# EasyEDA Pro project ProDoc_EthernetSwitch_2026-02-25.epro, schematic EthernetSwitch

## Sheets
1 EthernetSwitch: Board Name: EthernetSwitch; Create Date: 2026-02-14; Page Name: EthernetSwitch; Project Name: EthernetSwitch; Schematic Name: EthernetSwitch; Update Date: 2026-02-14; File: EthernetSwitch; Id: /; Sheet: /
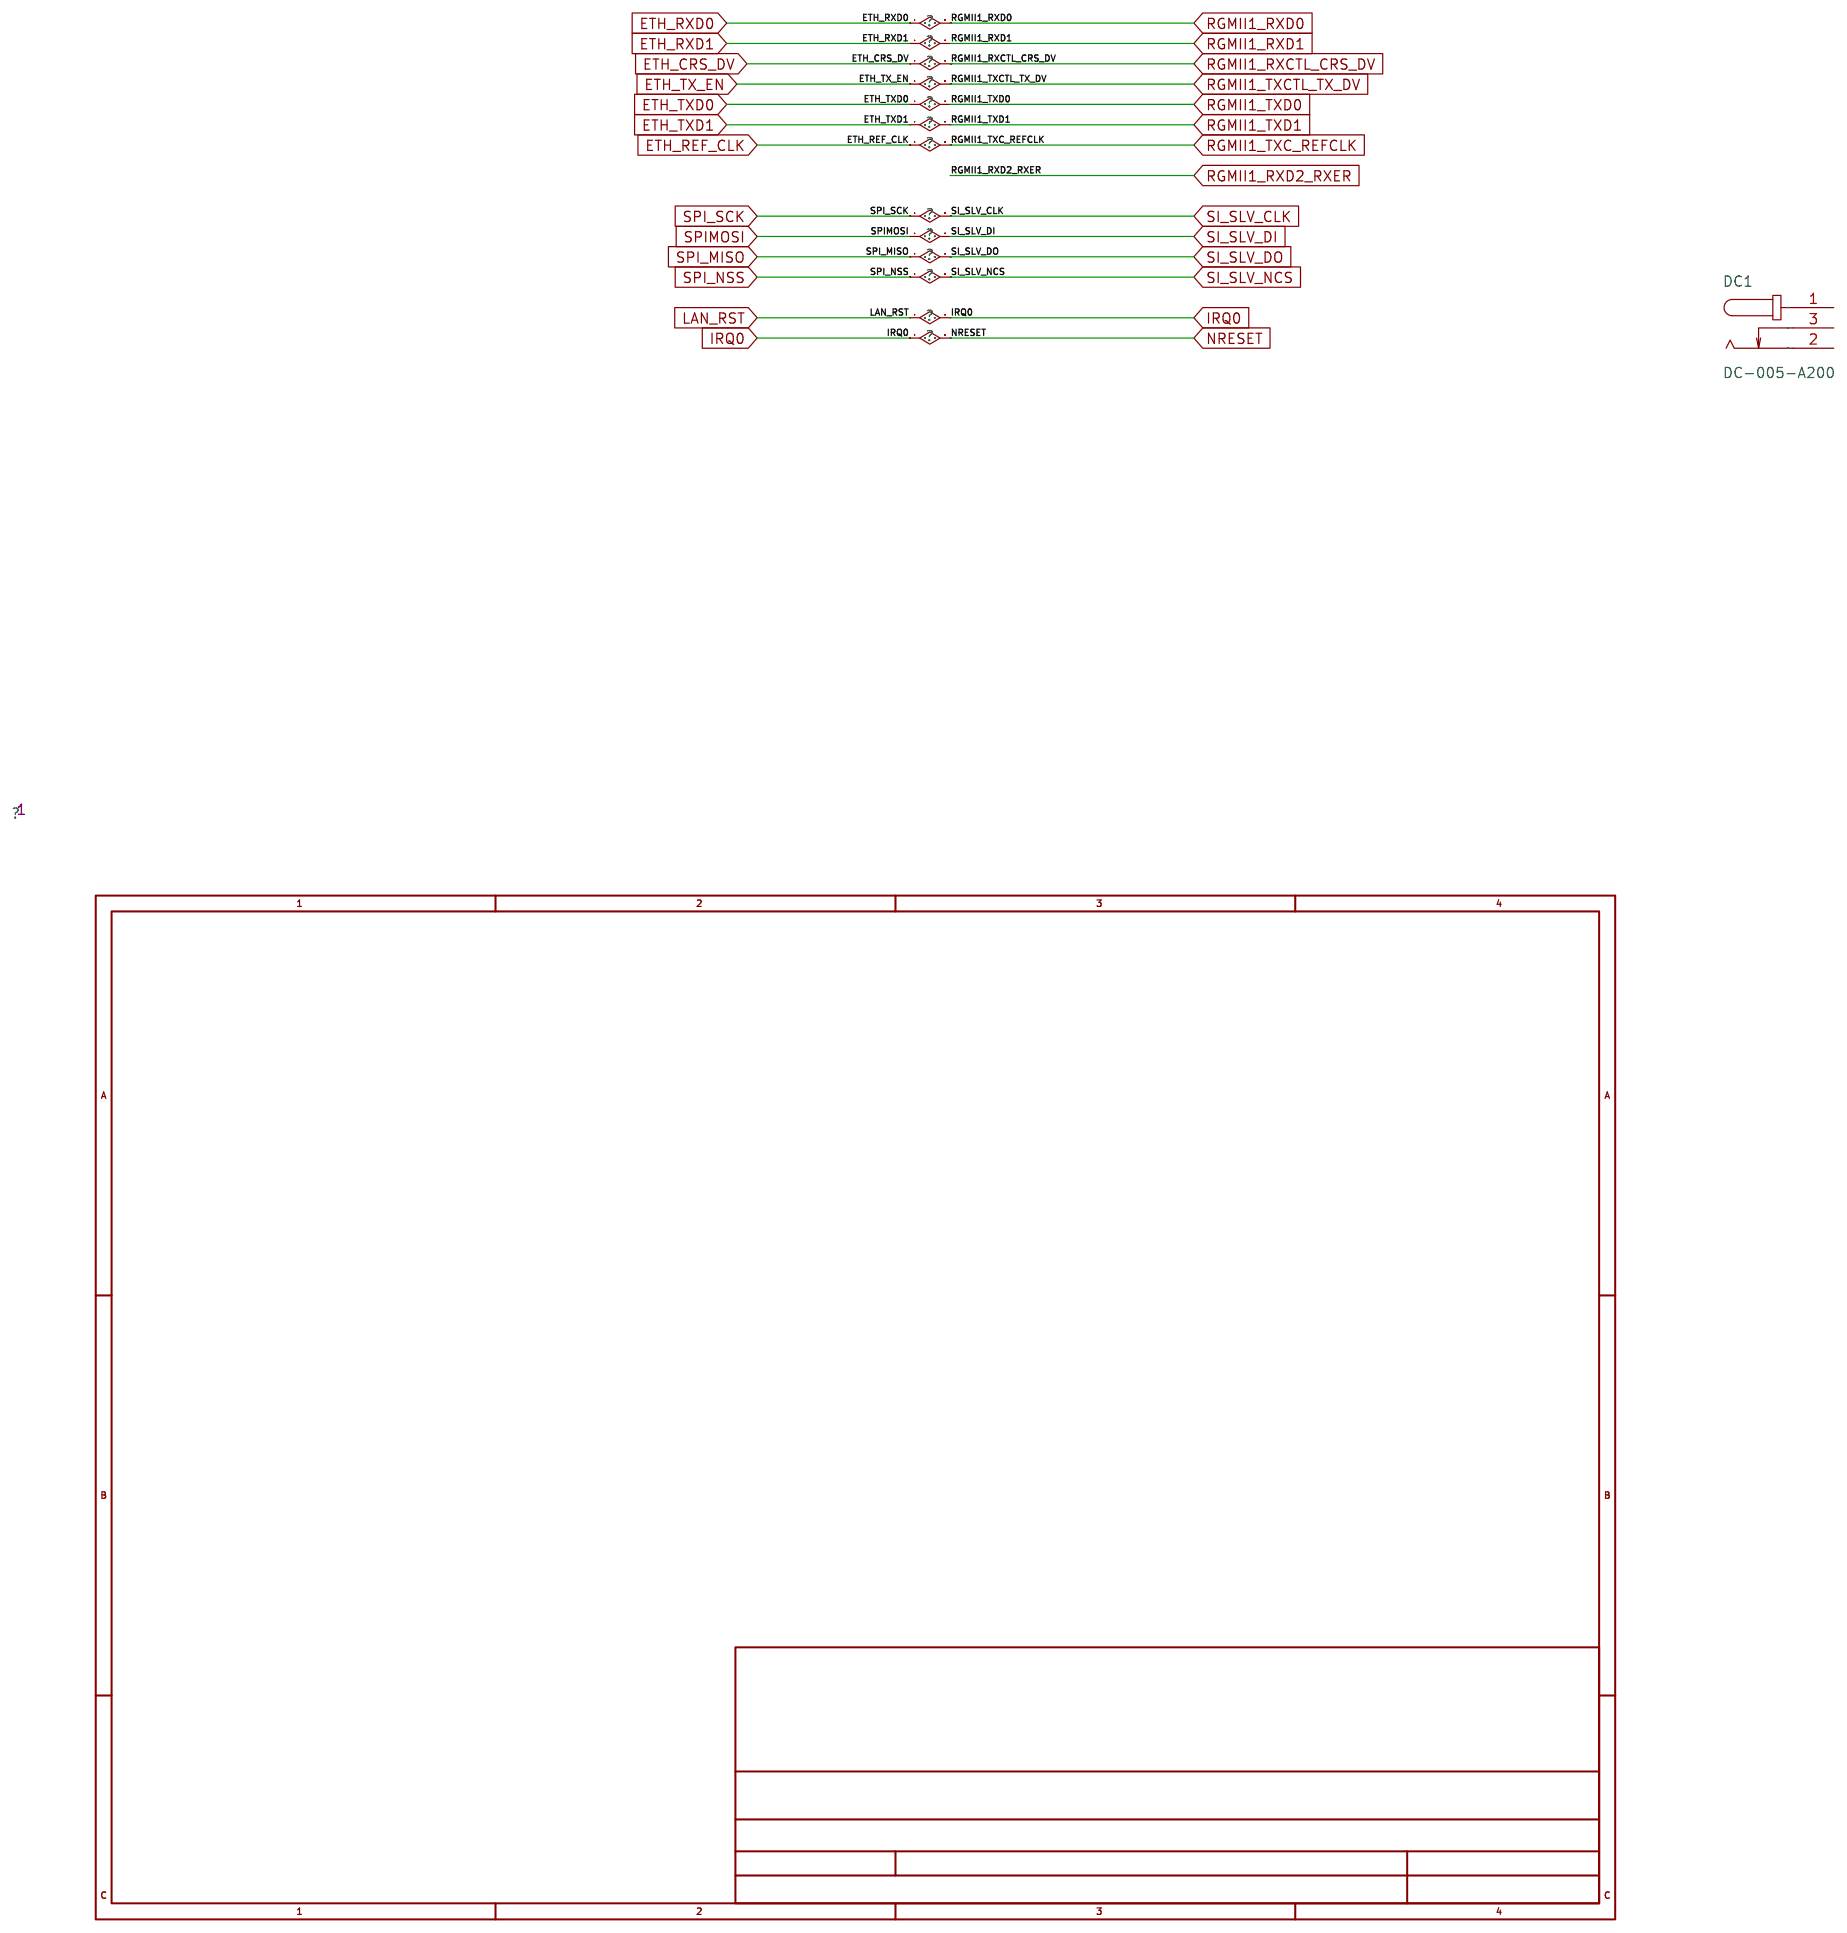
[diagram p0: EthernetSwitch]
2 mcu: Page Name: mcu; Company: EasyEDA.com; Page Size: A4; Version: V1.0
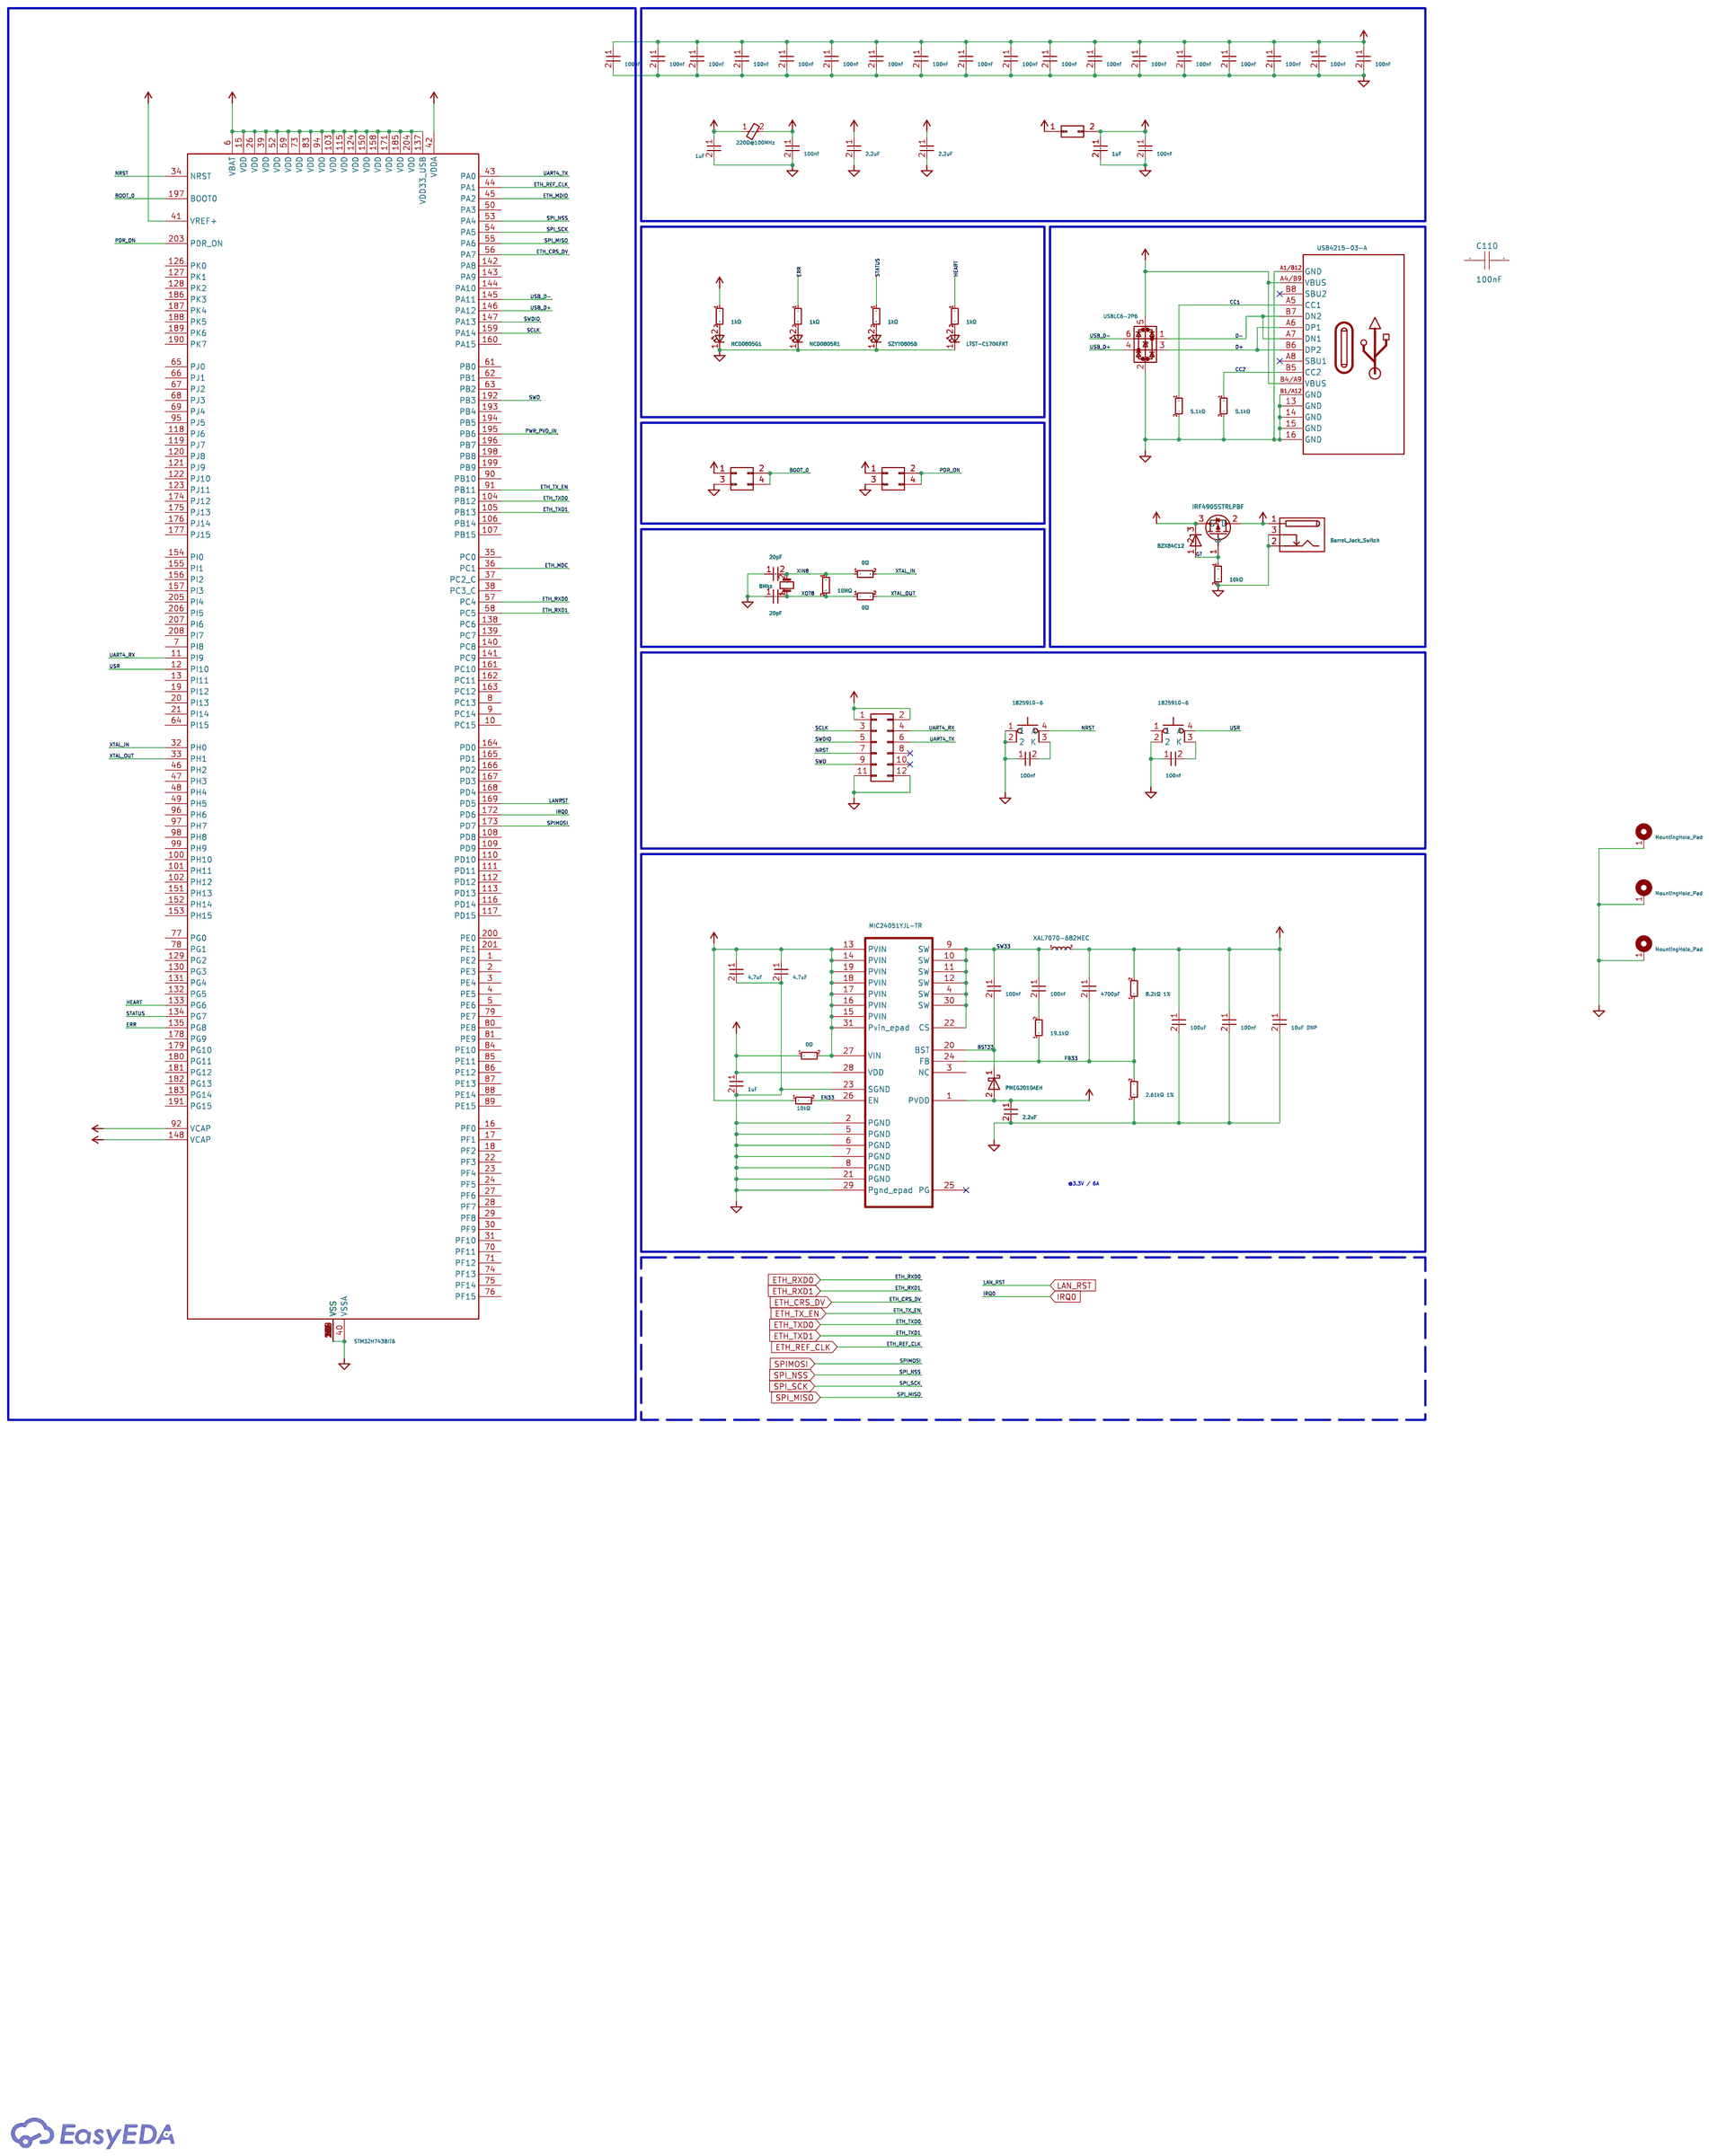
[diagram p1: mcu]
3 switch: Page Name: switch; Company: EasyEDA.com; Page Size: A4; Version: V1.0
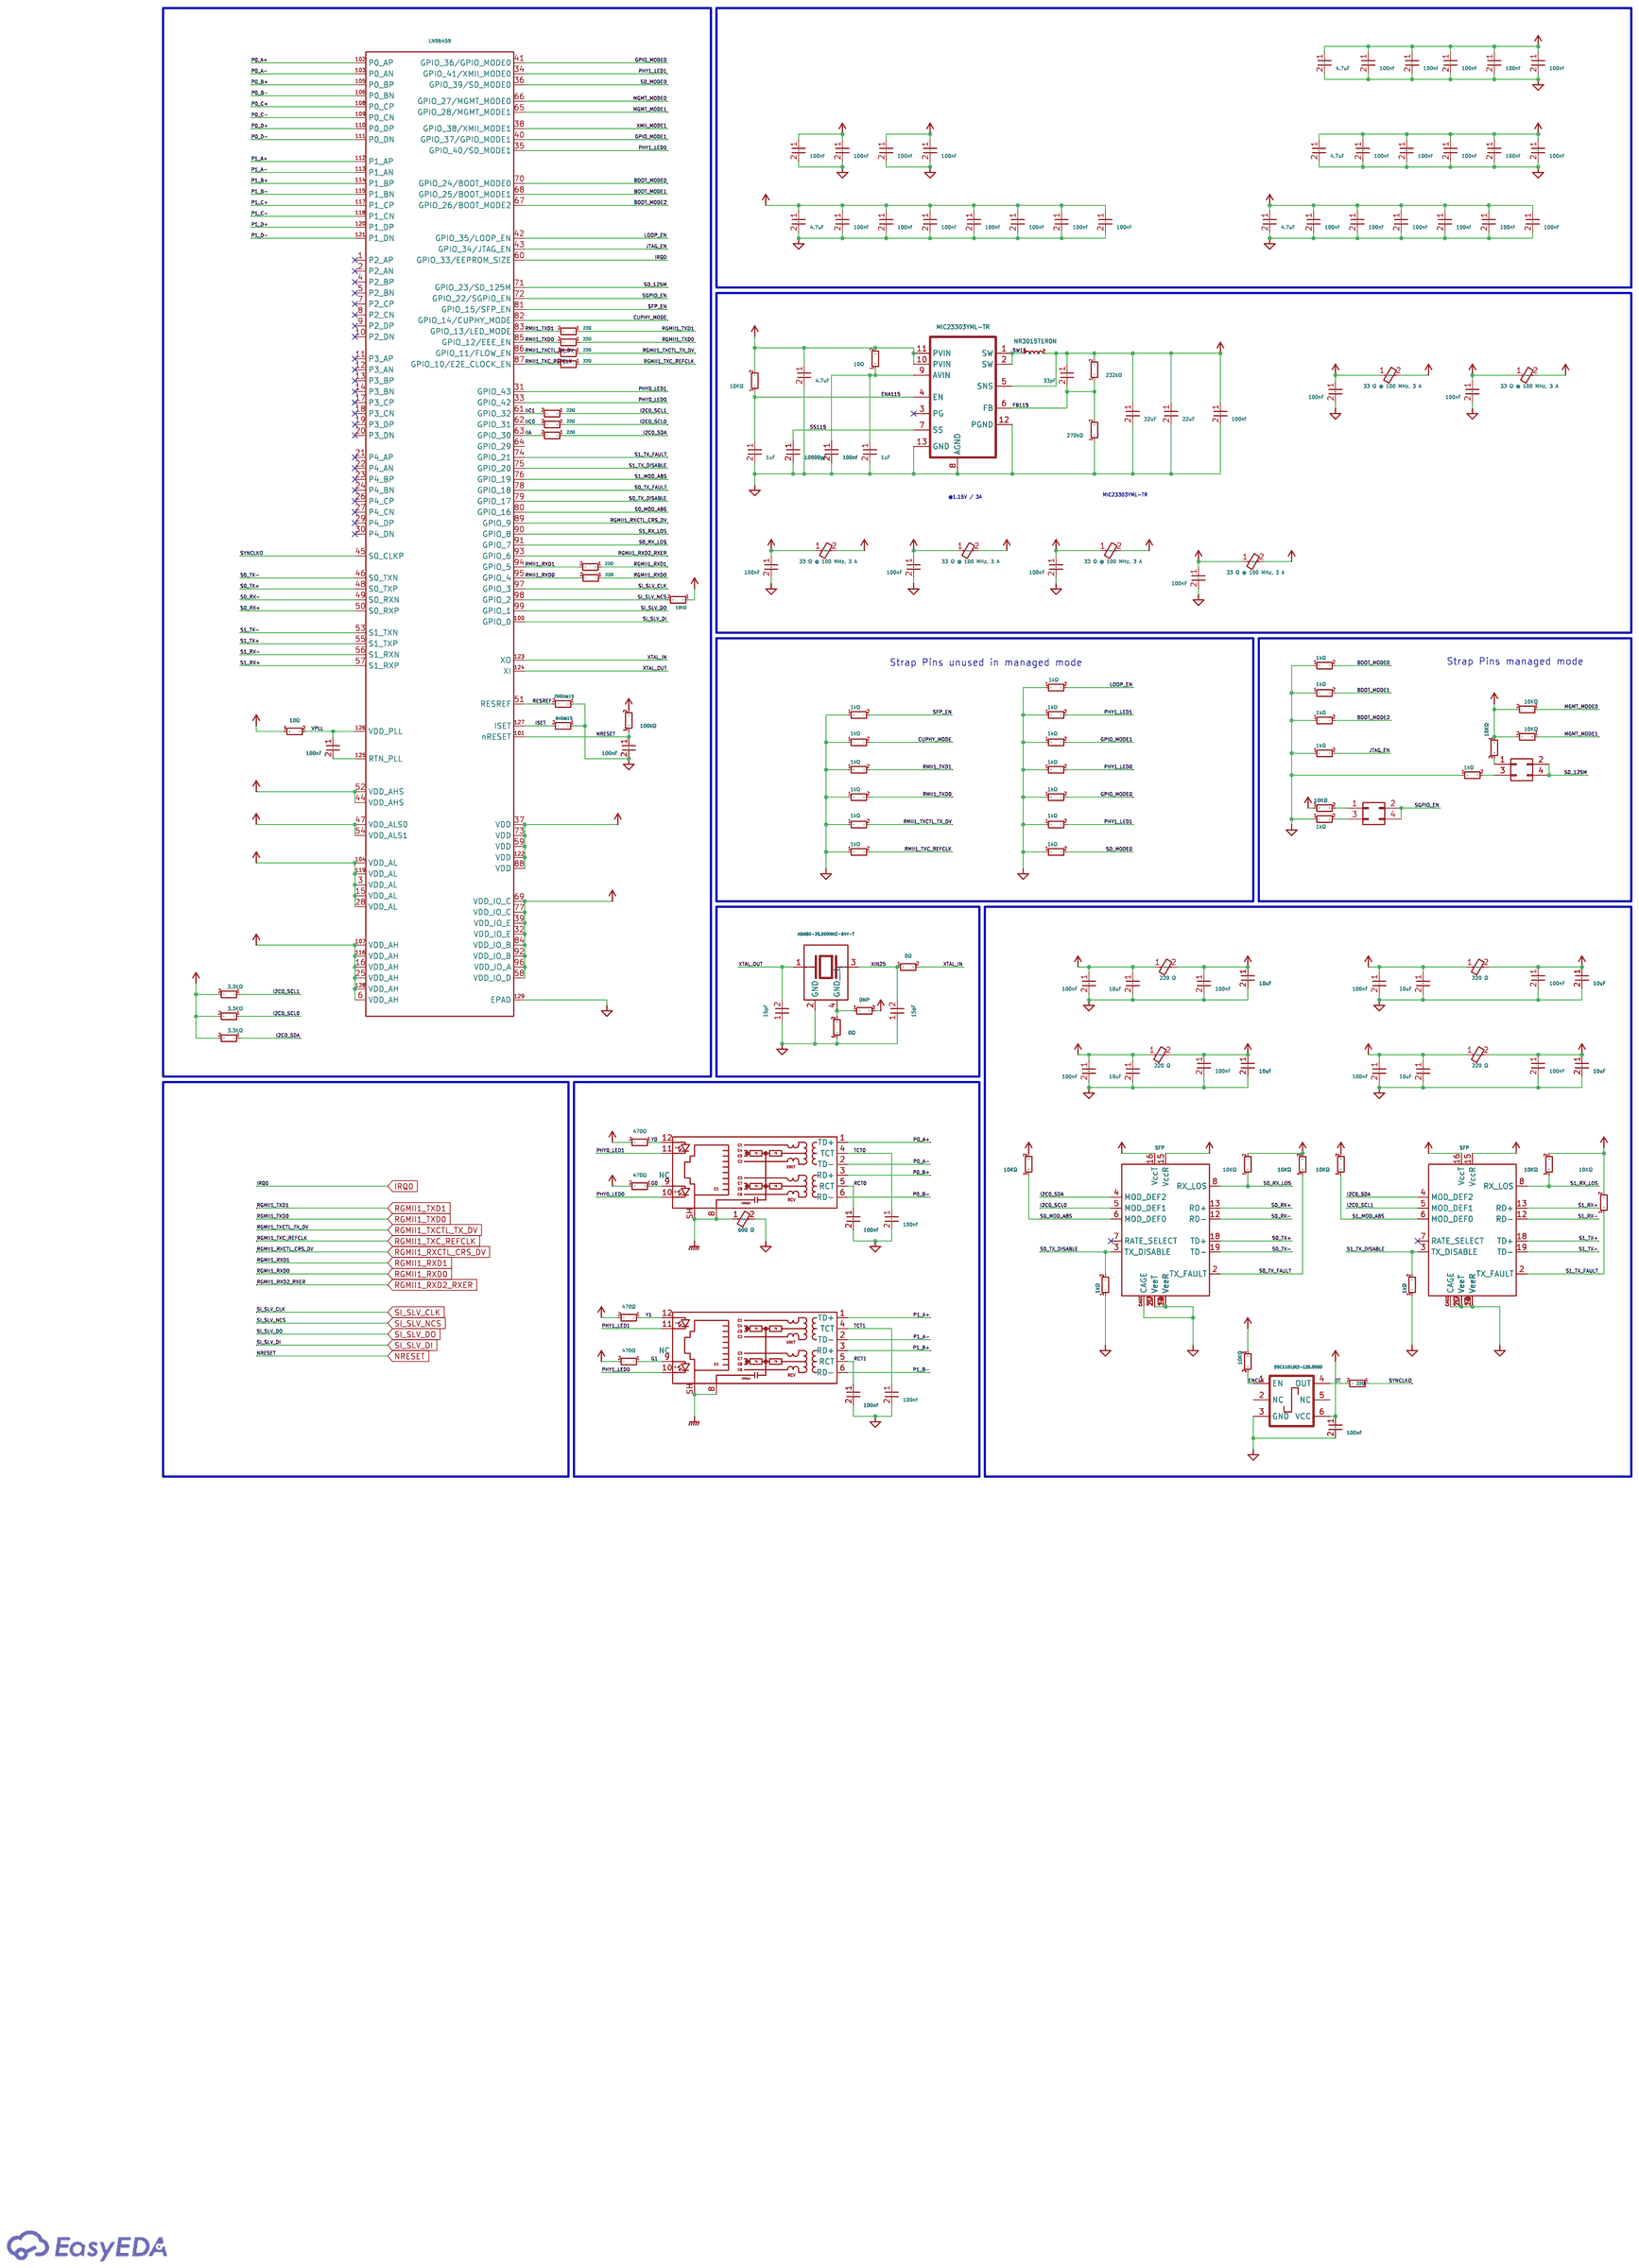
[diagram p2: switch]

## Parts
sheet EthernetSwitch
DC1  DC-005-A200  [DC-IN-TH_DC-005-A200]
sheet mcu
C1  100nf  [Capacitor_SMD:C_0603_1608Metric]
C2  1uF  [Capacitor_SMD:C_0603_1608Metric]
C3  4.7uF  [Capacitor_SMD:C_0603_1608Metric]
C4  1uF  [Capacitor_SMD:C_0805_2012Metric]
C5  100nf  [Capacitor_SMD:C_0603_1608Metric]
C6  20pF  [Capacitor_SMD:C_0805_2012Metric]
C7  20pF  [Capacitor_SMD:C_0805_2012Metric]
C8  4.7uF  [Capacitor_SMD:C_0603_1608Metric]
C9  100nf  [Capacitor_SMD:C_0603_1608Metric]
C10  100nf  [Capacitor_SMD:C_0603_1608Metric]
C11  100nf  [Capacitor_SMD:C_0603_1608Metric]
C12  2.2uF  [Capacitor_SMD:C_0603_1608Metric]
C13  100nf  [Capacitor_SMD:C_0603_1608Metric]
C14  100nf  [Capacitor_SMD:C_0603_1608Metric]
C15  2.2uF  [Capacitor_SMD:C_0603_1608Metric]
C16  100nf  [Capacitor_SMD:C_0603_1608Metric]
C17  100nf  [Capacitor_SMD:C_0805_2012Metric]
C18  100nf  [Capacitor_SMD:C_0603_1608Metric]
C19  2.2uF  [Capacitor_SMD:C_0603_1608Metric]
C20  100nf  [Capacitor_SMD:C_0805_2012Metric]
C21  100nf  [Capacitor_SMD:C_0805_2012Metric]
C22  100nf  [Capacitor_SMD:C_0603_1608Metric]
C23  4700pF  [Capacitor_SMD:C_0402_1005Metric]
C24  100nf  [Capacitor_SMD:C_0603_1608Metric]
C25  1uF  [Capacitor_SMD:C_0603_1608Metric]
C26  100nf  [Capacitor_SMD:C_0603_1608Metric]
C27  100nf  [Capacitor_SMD:C_0603_1608Metric]
C28  100nf  [Capacitor_SMD:C_0805_2012Metric]
C29  100uF  [Capacitor_SMD:C_1206_3216Metric]
C30  100nf  [Capacitor_SMD:C_0603_1608Metric]
C31  100nf  [Capacitor_SMD:C_0603_1608Metric]
C32  100nf  [Capacitor_SMD:C_0805_2012Metric]
C33  100nf  [Capacitor_SMD:C_0603_1608Metric]
C34  10uF DNP  [Capacitor_SMD:C_0805_2012Metric]
C35  100nf  [Capacitor_SMD:C_0603_1608Metric]
C36  100nf  [Capacitor_SMD:C_0603_1608Metric]
C108  100nf  [Capacitor_SMD:C_0603_1608Metric]
C109  100nf  [Capacitor_SMD:C_0603_1608Metric]
C110  100nF  [C0603]
D1  NCD0805G1  [LED_SMD:LED_0603_1608Metric]
D2  NCD0805R1  [LED_SMD:LED_0603_1608Metric]
D3  SZYY0805B  [LED_SMD:LED_0603_1608Metric]
D4  LTST-C170KFKT  [LED_SMD:LED_0603_1608Metric]
D5  PMEG2010AEH  [Diode_SMD:D_SOD-123F]
D6  BZX84C12  [Package_TO_SOT_SMD:SOT-23-3]
FB1  220Ω@100MHz  [Inductor_SMD:L_0805_2012Metric]
H1  MountingHole_Pad  [MountingHole:MountingHole_4.3mm_M4_Pad]
H2  MountingHole_Pad  [MountingHole:MountingHole_4.3mm_M4_Pad]
H3  MountingHole_Pad  [MountingHole:MountingHole_4.3mm_M4_Pad]
J1  Conn_02x02_Row_Letter_Last  [Connector_PinHeader_2.54mm:PinHeader_2x02_P2.54mm_Vertical]
J2  Conn_02x06_Row_Letter_Last  [Connector_PinHeader_2.54mm:PinHeader_2x06_P2.54mm_Vertical]
J3  Conn_02x02_Row_Letter_Last  [Connector_PinHeader_2.54mm:PinHeader_2x02_P2.54mm_Vertical]
J4  Conn_02x01_Row_Letter_First  [Connector_PinHeader_2.54mm:PinHeader_2x01_P2.54mm_Vertical]
J5  Barrel_Jack_Switch  [Connector_BarrelJack:BarrelJack_GCT_DCJ200-10-A_Horizontal]
J13  USB4215-03-A  [USB4215-03-A:CONN_8p94X6p5X3p16_12L_GCC]
L1  XAL7070-682MEC  [XAL7070-682MEC:IND_XAL7070_COC]
Q1  IRF4905STRLPBF  [IRF4905STRLPBF:TRAN_IRF4905STRLPBF_INF]
R1  1kΩ  [Resistor_SMD:R_0603_1608Metric]
R2  1kΩ  [Resistor_SMD:R_0603_1608Metric]
R3  10kΩ  [Resistor_SMD:R_0603_1608Metric]
R4  0Ω  [Resistor_SMD:R_0603_1608Metric]
R5  10MΩ  [Resistor_SMD:R_0603_1608Metric]
R6  0Ω  [Resistor_SMD:R_0603_1608Metric]
R7  0Ω  [Resistor_SMD:R_0603_1608Metric]
R8  1kΩ  [Resistor_SMD:R_0603_1608Metric]
R9  1kΩ  [Resistor_SMD:R_0603_1608Metric]
R10  19.1kΩ  [Resistor_SMD:R_0805_2012Metric]
R11  8.2kΩ 1%  [Resistor_SMD:R_0805_2012Metric]
R12  2.61kΩ 1%  [Resistor_SMD:R_0805_2012Metric]
R13  5.1kΩ  [Resistor_SMD:R_0603_1608Metric]
R14  10kΩ  [Resistor_SMD:R_0603_1608Metric]
R15  5.1kΩ  [Resistor_SMD:R_0603_1608Metric]
SW1  1825910-6  [1825910-6:SW_1825910-6-4]
SW2  1825910-6  [1825910-6:SW_1825910-6-4]
U1  STM32H743BIT6  [Package_QFP:LQFP-208_28x28mm_P0.5mm]
U2  MIC24051YJL-TR  [MIC24051:QFN28_5X6_MCH]
U3  USBLC6-2P6  [Package_TO_SOT_SMD:SOT-666]
Y1  8Mhz  [Crystal:Crystal_SMD_HC49-SD]
sheet switch
C37  100nF  [Capacitor_SMD:C_0603_1608Metric]
C38  100nF  [Capacitor_SMD:C_0603_1608Metric]
C39  1uF  [Capacitor_SMD:C_0805_2012Metric]
C40  100nF  [Capacitor_SMD:C_0603_1608Metric]
C41  15pF  [Capacitor_SMD:C_0603_1608Metric]
C42  10000pF  [Capacitor_SMD:C_0402_1005Metric]
C43  100nf  [Capacitor_SMD:C_0603_1608Metric]
C44  4.7uF  [Capacitor_SMD:C_0603_1608Metric]
C45  4.7uF  [Capacitor_SMD:C_0603_1608Metric]
C46  100nf  [Capacitor_SMD:C_0805_2012Metric]
C47  100nf  [Capacitor_SMD:C_0805_2012Metric]
C48  100nf  [Capacitor_SMD:C_0603_1608Metric]
C49  100nf  [Capacitor_SMD:C_0603_1608Metric]
C50  100nf  [Capacitor_SMD:C_0603_1608Metric]
C51  1uF  [Capacitor_SMD:C_0805_2012Metric]
C52  100nf  [Capacitor_SMD:C_0603_1608Metric]
C53  100nf  [Capacitor_SMD:C_0603_1608Metric]
C54  100nf  [Capacitor_SMD:C_0603_1608Metric]
C55  100nf  [Capacitor_SMD:C_0603_1608Metric]
C56  15pF  [Capacitor_SMD:C_0603_1608Metric]
C57  100nF  [Capacitor_SMD:C_0603_1608Metric]
C58  100nf  [Capacitor_SMD:C_0805_2012Metric]
C59  100nf  [Capacitor_SMD:C_0603_1608Metric]
C60  100nf  [Capacitor_SMD:C_0603_1608Metric]
C61  100nf  [Capacitor_SMD:C_0603_1608Metric]
C62  100nF  [Capacitor_SMD:C_0603_1608Metric]
C63  100nf  [Capacitor_SMD:C_0603_1608Metric]
C64  33pF  [Capacitor_SMD:C_0603_1608Metric]
C65  100nF  [Capacitor_SMD:C_0603_1608Metric]
C66  100nF  [Capacitor_SMD:C_0603_1608Metric]
C67  100nf  [Capacitor_SMD:C_0603_1608Metric]
C68  22uF  [Capacitor_SMD:C_0805_2012Metric]
C69  10uF  [Capacitor_SMD:C_0603_1608Metric]
C70  10uF  [Capacitor_SMD:C_0603_1608Metric]
C71  22uF  [Capacitor_SMD:C_0805_2012Metric]
C72  100nF  [Capacitor_SMD:C_0603_1608Metric]
C73  100nF  [Capacitor_SMD:C_0603_1608Metric]
C74  100nF  [Capacitor_SMD:C_0603_1608Metric]
C75  100nf  [Capacitor_SMD:C_0805_2012Metric]
C76  10uF  [Capacitor_SMD:C_0603_1608Metric]
C77  10uF  [Capacitor_SMD:C_0603_1608Metric]
C78  4.7uF  [Capacitor_SMD:C_0603_1608Metric]
C79  100nf  [Capacitor_SMD:C_0603_1608Metric]
C80  4.7uF  [Capacitor_SMD:C_0603_1608Metric]
C81  4.7uF  [Capacitor_SMD:C_0603_1608Metric]
C82  100nF  [Capacitor_SMD:C_0603_1608Metric]
C83  100nf  [Capacitor_SMD:C_0603_1608Metric]
C84  100nf  [Capacitor_SMD:C_0603_1608Metric]
C85  100nf  [Capacitor_SMD:C_0603_1608Metric]
C86  100nf  [Capacitor_SMD:C_0603_1608Metric]
C87  100nF  [Capacitor_SMD:C_0603_1608Metric]
C88  100nF  [Capacitor_SMD:C_0603_1608Metric]
C89  100nf  [Capacitor_SMD:C_0603_1608Metric]
C90  100nf  [Capacitor_SMD:C_0603_1608Metric]
C91  100nf  [Capacitor_SMD:C_0603_1608Metric]
C92  10uF  [Capacitor_SMD:C_0603_1608Metric]
C93  10uF  [Capacitor_SMD:C_0603_1608Metric]
C94  100nf  [Capacitor_SMD:C_0603_1608Metric]
C95  100nf  [Capacitor_SMD:C_0603_1608Metric]
C96  100nf  [Capacitor_SMD:C_0603_1608Metric]
C97  100nF  [Capacitor_SMD:C_0603_1608Metric]
C98  100nf  [Capacitor_SMD:C_0603_1608Metric]
C99  100nf  [Capacitor_SMD:C_0603_1608Metric]
C100  100nf  [Capacitor_SMD:C_0603_1608Metric]
C101  100nf  [Capacitor_SMD:C_0603_1608Metric]
C102  100nf  [Capacitor_SMD:C_0805_2012Metric]
C103  100nf  [Capacitor_SMD:C_0603_1608Metric]
C104  100nF  [Capacitor_SMD:C_0603_1608Metric]
C105  100nF  [Capacitor_SMD:C_0603_1608Metric]
C106  10uF  [Capacitor_SMD:C_0603_1608Metric]
C107  10uF  [Capacitor_SMD:C_0603_1608Metric]
FB2  600 Ω  [Inductor_SMD:L_0603_1608Metric]
FB4  33 Ω @ 100 MHz, 3 A  [Inductor_SMD:L_0603_1608Metric]
FB5  33 Ω @ 100 MHz, 3 A  [Inductor_SMD:L_0603_1608Metric]
FB6  33 Ω @ 100 MHz, 3 A  [Inductor_SMD:L_0603_1608Metric]
FB7  220 Ω  [Inductor_SMD:L_0603_1608Metric]
FB8  220 Ω  [Inductor_SMD:L_0603_1608Metric]
FB10  33 Ω @ 100 MHz, 3 A  [Inductor_SMD:L_0603_1608Metric]
FB11  33 Ω @ 100 MHz, 3 A  [Inductor_SMD:L_0603_1608Metric]
FB13  220 Ω  [Inductor_SMD:L_0603_1608Metric]
FB14  220 Ω  [Inductor_SMD:L_0603_1608Metric]
FB15  33 Ω @ 100 MHz, 3 A  [Inductor_SMD:L_0603_1608Metric]
J7  RJ45_Hanrun_HR911105A_Horizontal  [Connector_RJ:RJ45_Hanrun_HR911105A_Horizontal]
J8  RJ45_Hanrun_HR911105A_Horizontal  [Connector_RJ:RJ45_Hanrun_HR911105A_Horizontal]
J9  SFP  [Connector:Connector_SFP_and_Cage]
J10  Conn_02x02_Row_Letter_Last  [Connector_PinHeader_2.54mm:PinHeader_2x02_P2.54mm_Vertical]
J11  SFP  [Connector:Connector_SFP_and_Cage]
J12  Conn_02x02_Row_Letter_Last  [Connector_PinHeader_2.54mm:PinHeader_2x02_P2.54mm_Vertical]
L2  NR3015T1R0N  [NR3015T1R0N:IND_TAIYO_NR3015_TAY]
R16  3.3KΩ  [Resistor_SMD:R_0603_1608Metric]
R17  3.3KΩ  [Resistor_SMD:R_0603_1608Metric]
R18  3.3KΩ  [Resistor_SMD:R_0603_1608Metric]
R19  10Ω  [Resistor_SMD:R_0603_1608Metric]
R20  22Ω  [Resistor_SMD:R_0603_1608Metric]
R21  22Ω  [Resistor_SMD:R_0603_1608Metric]
R22  22Ω  [Resistor_SMD:R_0603_1608Metric]
R23  22Ω  [Resistor_SMD:R_0603_1608Metric]
R24  22Ω  [Resistor_SMD:R_0603_1608Metric]
R25  22Ω  [Resistor_SMD:R_0603_1608Metric]
R26  22Ω  [Resistor_SMD:R_0603_1608Metric]
R27  22Ω  [Resistor_SMD:R_0603_1608Metric]
R28  22Ω  [Resistor_SMD:R_0603_1608Metric]
R29  200Ω@1%  [Resistor_SMD:R_0805_2012Metric]
R30  6kΩ@1%  [Resistor_SMD:R_0805_2012Metric]
R31  100kΩ  [Resistor_SMD:R_0603_1608Metric]
R32  470Ω  [Resistor_SMD:R_0603_1608Metric]
R33  470Ω  [Resistor_SMD:R_0603_1608Metric]
R34  470Ω  [Resistor_SMD:R_0603_1608Metric]
R35  470Ω  [Resistor_SMD:R_0603_1608Metric]
R36  10KΩ  [Resistor_SMD:R_0603_1608Metric]
R37  10KΩ  [Resistor_SMD:R_0603_1608Metric]
R38  0Ω  [Resistor_SMD:R_0603_1608Metric]
R39  1kΩ  [Resistor_SMD:R_0603_1608Metric]
R40  1kΩ  [Resistor_SMD:R_0603_1608Metric]
R41  1kΩ  [Resistor_SMD:R_0603_1608Metric]
R42  1kΩ  [Resistor_SMD:R_0603_1608Metric]
R43  1kΩ  [Resistor_SMD:R_0603_1608Metric]
R44  1kΩ  [Resistor_SMD:R_0603_1608Metric]
R45  DNP  [Resistor_SMD:R_0805_2012Metric]
R46  10Ω  [Resistor_SMD:R_0603_1608Metric]
R47  0Ω  [Resistor_SMD:R_0603_1608Metric]
R48  10KΩ  [Resistor_SMD:R_0603_1608Metric]
R49  1kΩ  [Resistor_SMD:R_0603_1608Metric]
R50  1kΩ  [Resistor_SMD:R_0603_1608Metric]
R51  1kΩ  [Resistor_SMD:R_0603_1608Metric]
R52  1kΩ  [Resistor_SMD:R_0603_1608Metric]
R53  1kΩ  [Resistor_SMD:R_0603_1608Metric]
R54  1kΩ  [Resistor_SMD:R_0603_1608Metric]
R55  1kΩ  [Resistor_SMD:R_0603_1608Metric]
R56  232kΩ  [Resistor_SMD:R_0805_2012Metric]
R57  270kΩ  [Resistor_SMD:R_0603_1608Metric]
R58  1kΩ  [Resistor_SMD:R_0603_1608Metric]
R59  10KΩ  [Resistor_SMD:R_0603_1608Metric]
R60  10KΩ  [Resistor_SMD:R_0603_1608Metric]
R61  10KΩ  [Resistor_SMD:R_0603_1608Metric]
R62  1kΩ  [Resistor_SMD:R_0603_1608Metric]
R63  1kΩ  [Resistor_SMD:R_0603_1608Metric]
R64  1kΩ  [Resistor_SMD:R_0603_1608Metric]
R65  1kΩ  [Resistor_SMD:R_0603_1608Metric]
R66  10KΩ  [Resistor_SMD:R_0603_1608Metric]
R67  1kΩ  [Resistor_SMD:R_0603_1608Metric]
R68  10KΩ  [Resistor_SMD:R_0603_1608Metric]
R69  22Ω  [Resistor_SMD:R_0603_1608Metric]
R70  1kΩ  [Resistor_SMD:R_0603_1608Metric]
R71  1kΩ  [Resistor_SMD:R_0603_1608Metric]
R72  10KΩ  [Resistor_SMD:R_0603_1608Metric]
R73  10KΩ  [Resistor_SMD:R_0603_1608Metric]
R74  10KΩ  [Resistor_SMD:R_0603_1608Metric]
R75  10KΩ  [Resistor_SMD:R_0603_1608Metric]
R76  10KΩ  [Resistor_SMD:R_0603_1608Metric]
U4  LN96459  [Library:128-TQFP]
U5  MIC23303YML-TR  [MIC23303:DFN12_3X3_ML_MCH]
Y2  ABM8G-25.000MHZ-B4Y-T  [ABM8G-25.000MHZ-B4Y-T:XTAL_ABM8G-25.000MHZ-B4Y-T]
Y3  DSC1101BI2-125.0000  [Library:6-VDFN]

## Library data of the parts
DC1 = DC-005-A200: Connector Type:DC Power Jack Mounting Type:Right Angle Inside Contact Diameter:2mm Outside Contact Diameter:6.4mm Current Rating:3A Voltage Rating (Max):30V Operating Temperature:-20℃~+70℃ Operating Temperature:-20℃~+70℃; LCSC Part Name: DC电源插座 内径:2mm 外径:6.4mm; Supplier Part: C720557; Manufacturer: XUNPU(讯普); Supplier Footprint: 插件; JLCPCB Part Class: Extended Part; Datasheet: https://item.szlcsc.com/datasheet/DC-005-A200/763564.html; Supplier: LCSC; Connector Type: DC Power Jack; Mounting Type: Right Angle; Inside Contact Diameter: 2mm; Outside Contact Diameter: 6.4mm; Current Rating: 3A; Voltage Rating (Max): 30V; Operating Temperature: -20℃~+70℃
C1-C3 C5 C9-C16 C18 C19 C22 C24-C27 C30 C31 C33 C35 C36 C108 C109 = Device_C_Small: Unpolarized capacitor, small symbol; Field5: C1608X5R1C475K080AC; ref: C1608X5R1C225K
C4 C6 C7 C17 C20 C21 C28 C32 C34 = Device_C_Small: Unpolarized capacitor, small symbol
C8 = Device_C_Small: Unpolarized capacitor, small symbol; Field5: 'C1608X5R1C475K080AC; ref: C1608X5R1C225K
C23 = Device_C_Small: Unpolarized capacitor, small symbol; ref: GRM155R71C472KA01D
C29 = Device_C_Small: Unpolarized capacitor, small symbol; ref: C3225X5R0J107M250AC
C110 = CC0603KRX7R9BB104: Capacitance:100nF Tolerance:±10% Tolerance:±10% Voltage Rating:50V Temperature Coefficient:X7R; LCSC Part Name: 100nF ±10% 50V; Supplier Part: C14663; Manufacturer: YAGEO(国巨); Supplier Footprint: 0603; JLCPCB Part Class: Basic Part; Datasheet: https://item.szlcsc.com/datasheet/CC0603KRX7R9BB104/15331.html; Supplier: LCSC; Tolerance: ±10%; Voltage Rating: 50V; Temperature Coefficient: X7R
D1-D3 = Device_LED_Small: Light emitting diode, small symbol; Attribute1: D4; Sim_Pins: 1=K 2=A; Sim.Pins: 1=K 2=A
D4 = Device_LED_Small: Light emitting diode, small symbol; Sim_Pins: 1=K 2=A; Sim.Pins: 1=K 2=A
D5 = Diode_PMEG2010AEH: 20V, 1A very low Vf MEGA Schottky barrier rectifier, SOD-123F; Datasheet: https://assets.nexperia.com/documents/data-sheet/PMEG2010AEH_PMEG2010AET.pdf; User doc link: https://assets.nexperia.com/documents/data-sheet/PMEG2010AEH_PMEG2010AET.pdf
D6 = Diode_BZX84Cxx: 300mW Zener Diode, SOT-23; Datasheet: https://diotec.com/tl_files/diotec/files/pdf/datasheets/bzx84c2v4.pdf; User doc link: https://diotec.com/tl_files/diotec/files/pdf/datasheets/bzx84c2v4.pdf
FB1 = Device_FerriteBead_Small: Ferrite bead, small symbol
H1 H3 = Mechanical_MountingHole_Pad: Mounting Hole with connection; Attribute1: H2
H2 = Mechanical_MountingHole_Pad: Mounting Hole with connection
J1 J3 J10 = Connector_Generic_Conn_02x02_Row_Letter_Last: Generic connector, double row, 02x02, row letter last pin numbering scheme (pin number consists of a letter for the row and a number for the pin index in this row. 1a, ..., Na; 1b, ..., Nb)), script generated (kicad-library-utils/schlib/autogen/connector/)
J2 = Connector_Generic_Conn_02x06_Row_Letter_Last: Generic connector, double row, 02x06, row letter last pin numbering scheme (pin number consists of a letter for the row and a number for the pin index in this row. 1a, ..., Na; 1b, ..., Nb)), script generated (kicad-library-utils/schlib/autogen/connector/)
J4 = Connector_Generic_Conn_02x01_Row_Letter_First: Generic connector, double row, 02x01, row letter first pin numbering scheme (pin number consists of a letter for the row and a number for the pin index in this row. a1, ..., aN; b1, ..., bN), script generated (kicad-library-utils/schlib/autogen/connector/)
J5 = Connector_Barrel_Jack_Switch: DC Barrel Jack with an internal switch
J13 = USB4215-03-A_USB4215-03-A
L1 = XAL7070-682MEC_XAL7070-682MEC
Q1 = IRF4905STRLPBF_IRF4905STRLPBF: Attribute1: *; Attribute2: *; Attribute4: *; Attribute5: *; Datasheet: https://www.infineon.com/dgdl/irf4905spbf.pdf?fileId=5546d462533600a4015355e331c41980; User doc link: https://www.infineon.com/dgdl/irf4905spbf.pdf?fileId=5546d462533600a4015355e331c41980
R1-R15 = Device_R_Small: Resistor, small symbol
SW1 SW2 = 1825910-6_1825910-6: PARTREV: C10; STANDARD: Manufacturer Recommendations; MANUFACTURER: TE CONNECTIVITY
U1 = MCU_ST_STM32H7_STM32H743BITx: STMicroelectronics Arm Cortex-M7 MCU, 2048KB flash, 1024KB RAM, 480 MHz, 1.62-3.6V, 168 GPIO, LQFP208; Datasheet: https://www.st.com/resource/en/datasheet/stm32h743bi.pdf; User doc link: https://www.st.com/resource/en/datasheet/stm32h743bi.pdf
U2 = MIC24051_MIC24051YJL-TR: Attribute1: *; Attribute2: *; Attribute3: *; Attribute4: *
U3 = Power_Protection_USBLC6-2P6: Very low capacitance ESD protection diode, 2 data-line, SOT-666; Datasheet: https://www.st.com/resource/en/datasheet/usblc6-2.pdf; User doc link: https://www.st.com/resource/en/datasheet/usblc6-2.pdf
Y1 = Device_Crystal_Small: Two pin crystal, small symbol; Datasheet: https://www.lcsc.com/datasheet/C12674.pdf; REF: X49SM8MSD2SC; User doc link: https://www.lcsc.com/datasheet/C12674.pdf
C37 C38 C40 C43 C44 C48-C50 C52-C57 C59-C63 C65-C67 C69 C70 C72-C74 C76-C101 C103-C107 = Device_C_Small: Unpolarized capacitor, small symbol; Attribute1: C36; ref: GRM1555C1H150JA01D
C39 C46 C47 C51 C58 C68 C71 C75 C102 = Device_C_Small: Unpolarized capacitor, small symbol; Attribute1: C21; ref: C2012X5R1C226K
C41 = Device_C_Small: Unpolarized capacitor, small symbol; Attribute1: C36; ref: GRM1555C1H150JA01D; REF: GRM1555C1H150JA01D
C42 = Device_C_Small: Unpolarized capacitor, small symbol; ref: C0402C103K4RACTU
C45 = Device_C_Small: Unpolarized capacitor, small symbol; Attribute1: C36; ref: 06036D475KAT2A
C64 = Device_C_Small: Unpolarized capacitor, small symbol; Attribute1: C36; ref: GMC10CG330J50NTLF
FB2 FB4-FB8 FB10 FB13-FB15 = Device_FerriteBead_Small: Ferrite bead, small symbol; Attribute1: FB11; Field5: MPZ2012S601AT000
FB11 = Device_FerriteBead_Small: Ferrite bead, small symbol; Field5: MPZ2012S601AT000
J7 = Connector_RJ45_Hanrun_HR911105A_Horizontal: 1 Port RJ45 Magjack Connector Through Hole 10/100 Base-T, AutoMDIX; Datasheet: https://datasheet.lcsc.com/lcsc/1811141815_HANRUN-Zhongshan-HanRun-Elec-HR911105A_C12074.pdf; User doc link: https://datasheet.lcsc.com/lcsc/1811141815_HANRUN-Zhongshan-HanRun-Elec-HR911105A_C12074.pdf
J8 = Connector_RJ45_Hanrun_HR911105A_Horizontal: 1 Port RJ45 Magjack Connector Through Hole 10/100 Base-T, AutoMDIX; Attribute1: J7; Datasheet: https://datasheet.lcsc.com/lcsc/1811141815_HANRUN-Zhongshan-HanRun-Elec-HR911105A_C12074.pdf; User doc link: https://datasheet.lcsc.com/lcsc/1811141815_HANRUN-Zhongshan-HanRun-Elec-HR911105A_C12074.pdf
J9 = Interface_Optical_SFP: Connector for Small Form Factor Pluggable (SFP) module, 1 Gbit/s, serial-to-serial data-agnostic optical transceiver; Attribute1: PCB edge; Attribute2: Component and trace keepout; Attribute3: (except chassis ground); Datasheet: http://www.10gtek.com/templates/wzten/pdf/INF-8074.pdf; User doc link: http://www.10gtek.com/templates/wzten/pdf/INF-8074.pdf
J11 = Interface_Optical_SFP: Connector for Small Form Factor Pluggable (SFP) module, 1 Gbit/s, serial-to-serial data-agnostic optical transceiver; Attribute1: PCB edge; Attribute2: Component and trace keepout; Attribute3: (except chassis ground); Attribute4: J9; Datasheet: http://www.10gtek.com/templates/wzten/pdf/INF-8074.pdf; User doc link: http://www.10gtek.com/templates/wzten/pdf/INF-8074.pdf
J12 = Connector_Generic_Conn_02x02_Row_Letter_Last: Generic connector, double row, 02x02, row letter last pin numbering scheme (pin number consists of a letter for the row and a number for the pin index in this row. 1a, ..., Na; 1b, ..., Nb)), script generated (kicad-library-utils/schlib/autogen/connector/); Attribute1: J10
L2 = NR3015T1R0N_NR3015T1R0N
R16-R28 R31-R44 R46-R55 R57-R76 = Device_R_Small: Resistor, small symbol; Attribute1: R9
R29 R30 R45 R56 = Device_R_Small: Resistor, small symbol; Attribute1: R11
U4 = lanchip_LAN96459S
U5 = MIC23303_MIC23303YML-TR
Y2 = ABM8G-25.000MHZ-B4Y-T_ABM8G-25.000MHZ-B4Y-T: PARTREV: 08.13.15; STANDARD: Manufacturer Recommendations; MAXIMUM_PACKAGE_HEIGHT: 1.0 mm; MANUFACTURER: Abracon
Y3 = lanchip_DSC1101BI2-125.0000: Low-Jitter Precision CMOS Oscillator; Datasheet: https://ww1.microchip.com/downloads/aemDocuments/documents/TCG/ProductDocuments/DataSheets/DSC1101-21-Low-Jitter-Precision-CMOS-Oscillator-DS20005613D.pdf; User doc link: https://ww1.microchip.com/downloads/aemDocuments/documents/TCG/ProductDocuments/DataSheets/DSC1101-21-Low-Jitter-Precision-CMOS-Oscillator-DS20005613D.pdf

## Nets
+1V15: C40.1 C57.1 C62.1 C64.1 C68.1 C71.1 C75.1 C81.1 C86.1 C91.1 C95.1 C99.1 C102.1 FB4.1 FB5.1 FB6.1 L2.2 R56.2 U4.37(VDD) U4.59(VDD) U4.73(VDD) U4.88(VDD) U4.122(VDD) U5.5(SNS)
+3V3A: C10.1 FB1.2 U1.42(VDDA)
VBUS: C3.1 C8.1 J13.A4/B9(VBUS) J13.B4/A9(VBUS) R3.1 R4.2 U2.13(PVIN) U2.14(PVIN) U2.15(PVIN) U2.16(PVIN) U2.17(PVIN) U2.18(PVIN) U2.19(PVIN) U2.27(VIN) U2.31(Pvin_epad) U3.5(VBUS)
VCCR1: C74.1 C77.1 FB7.2 J9.15(VccR)
VCCR2: C104.1 C106.1 FB13.2 J11.15(VccR)
VCCT1: C73.1 C76.1 FB8.2 J9.16(VccT)
VCCT2: C105.1 C107.1 FB14.2 J11.16(VccT)
VDDAH_PHY: C78.1 C79.1 C84.1 C89.1 C94.1 C98.1 C101.1 FB11.2 U4.6(VDD_AH) U4.16(VDD_AH) U4.25(VDD_AH) U4.107(VDD_AH) U4.116(VDD_AH) U4.128(VDD_AH)
VDDAH_SRDS: C43.1 C47.1 FB15.2
VDDAL_PHY: C80.1 C85.1 C90.1 C96.1 C100.1 C103.1 FB4.2 U4.3(VDD_AL) U4.15(VDD_AL) U4.28(VDD_AL) U4.104(VDD_AL) U4.119(VDD_AL)
VDDAL_PLL: FB6.2 R19.1 U4.44(VDD_AHS) U4.52(VDD_AHS)
VDDAL_SRDS: C52.1 C58.1 FB5.2 U4.47(VDD_ALS0) U4.54(VDD_ALS1)
VDDIO: C44.1 C48.1 C53.1 C59.1 C60.1 C61.1 C63.1 C67.1 FB10.2 U4.32(VDD_IO_E) U4.39(VDD_IO_E) U4.58(VDD_IO_D) U4.69(VDD_IO_C) U4.77(VDD_IO_C) U4.84(VDD_IO_B) U4.92(VDD_IO_B) U4.96(VDD_IO_A)
BOOT_0: J1.2(Pin_1b) J1.4(Pin_2b) U1.197(BOOT0)
BOOT_MODE0: R62.2 U4.70(GPIO_24/BOOT_MODE0)
BOOT_MODE1: R63.2 U4.68(GPIO_25/BOOT_MODE1)
BOOT_MODE2: R64.2 U4.67(GPIO_26/BOOT_MODE2)
BST33: C17.2 D5.1(K) U2.20(BST)
CC1: J13.A5(CC1) R13.1
CC2: J13.B5(CC2) R15.1
CUPHY_MODE: R40.2 U4.82(GPIO_14/CUPHY_MODE)
D+: J13.A6(DP1) J13.B6(DP2) U3.3(I/O2)
D-: J13.A7(DN1) J13.B7(DN2) U3.1(I/O1)
EN33: R3.2 U2.26(EN)
ENA115: C39.1 R37.1 U5.4(EN)
ENCLK: R60.2 Y3.1(EN)
ERR: R2.1 U1.135(PG8)
ETH_CRS_DV: U1.56(PA7) U4.89(GPIO_9)
ETH_MDC: U1.36(PC1)
ETH_MDIO: U1.45(PA2)
ETH_REF_CLK: R24.1 U1.44(PA1)
ETH_RXD0: U1.57(PC4)
ETH_RXD1: R20.1 U1.58(PC5)
ETH_TX_EN: R23.1 U1.91(PB11)
ETH_TXD0: R22.1 U1.104(PB12)
ETH_TXD1: R21.1 U1.105(PB13)
FB33: C23.2 R10.1 R11.1 R12.2 U2.24(FB)
FB115: C64.2 R56.1 R57.2 U5.6(FB)
G0: J7.9 R35.1
G1: J8.9 R33.1
GPIO_MODE0: R53.2 U4.41(GPIO_36/GPIO_MODE0)
GPIO_MODE1: R51.2 U4.40(GPIO_37/GPIO_MODE1)
GT: D6.1(A) Q1.1(G) R14.1
HEART: R9.1 U1.133(PG6)
I2C0_SCL0: J9.5(MOD_DEF1) R17.1 R26.1
I2C0_SCL1: J11.5(MOD_DEF1) R16.1 R25.1
I2C0_SDA: J9.4(MOD_DEF2) J11.4(MOD_DEF2) R18.1 R27.1
IIA: R27.2 U4.63(GPIO_30)
IIC0: R26.2 U4.62(GPIO_31)
IIC1: R25.2 U4.61(GPIO_32)
IRQ0: C38.1 R31.1 U1.172(PD6) U4.60(GPIO_33/EEPROM_SIZE) U4.101(nRESET)
ISET: R30.2 U4.127(ISET)
JTAG_EN: R65.2 U4.43(GPIO_34/JTAG_EN)
LANRST: U1.169(PD5)
LOOP_EN: R49.2 U4.42(GPIO_35/LOOP_EN)
MGMT_MODE0: R73.1 U4.66(GPIO_27/MGMT_MODE0)
MGMT_MODE1: R74.1 U4.65(GPIO_28/MGMT_MODE1)
NRST: J2.7(Pin_4a) SW1.4(A) U1.34(NRST)
OT: R69.2 Y3.4(OUT)
P0_A+: J7.1(TD+) U4.102(P0_AP)
P0_A-: J7.2(TD-) U4.103(P0_AN)
P0_B+: J7.3(RD+) U4.105(P0_BP)
P0_B-: J7.6(RD-) U4.106(P0_BN)
P0_C+: U4.108(P0_CP)
P0_C-: U4.109(P0_CN)
P0_D+: U4.110(P0_DP)
P0_D-: U4.111(P0_DN)
P1_A+: J8.1(TD+) U4.112(P1_AP)
P1_A-: J8.2(TD-) U4.113(P1_AN)
P1_B+: J8.3(RD+) U4.114(P1_BP)
P1_B-: J8.6(RD-) U4.115(P1_BN)
P1_C+: U4.117(P1_CP)
P1_C-: U4.118(P1_CN)
P1_D+: U4.120(P1_DP)
P1_D-: U4.121(P1_DN)
PDR_ON: J3.2(Pin_1b) J3.4(Pin_2b) U1.203(PDR_ON)
PHY0_LED0: J7.10 U4.33(GPIO_42)
PHY0_LED1: J7.11 U4.31(GPIO_43)
PHY1_LED0: J8.10 R52.2 U4.35(GPIO_40/SD_MODE1)
PHY1_LED1: J8.11 R50.2 R54.2 U4.34(GPIO_41/XMII_MODE0)
POWER_+3V3: C1.1 C2.1 C4.1 C5.1 C9.1 C11.1 C13.1 C14.1 C16.1 C18.1 C19.1 C22.1 C23.1 C24.1 C26.1 C29.1 C30.1 C31.1 C32.1 C33.1 C34.1 C35.1 C36.1 C45.1 C65.1 C66.1 C69.1 C70.1 C72.1 C82.1 C83.1 C87.1 C88.1 C92.1 C93.1 C97.1 C108.1 C109.1 D5.2(A) D6.3(K) FB1.1 FB7.1 FB8.1 FB10.1 FB11.1 FB13.1 FB14.1 FB15.1 J1.1(Pin_1a) J2.1(Pin_1a) J2.2(Pin_1b) J3.1(Pin_1a) J4.1(Pin_a1) L1.2 Q1.3(S) R1.1 R4.1 R11.2 R16.2 R17.2 R18.2 R31.2 R32.2 R33.2 R34.2 R35.2 R36.1 R37.2 R45.2 R46.2 R48.2 R59.2 R60.1 R61.2 R66.1 R68.2 R72.1 R73.2 R74.2 R75.2 R76.2 U1.6(VBAT) U1.15(VDD) U1.26(VDD) U1.39(VDD) U1.52(VDD) U1.59(VDD) U1.73(VDD) U1.83(VDD) U1.94(VDD) U1.103(VDD) U1.115(VDD) U1.124(VDD) U1.137(VDD33_USB) U1.150(VDD) U1.158(VDD) U1.171(VDD) U1.185(VDD) U1.204(VDD) U2.1(PVDD) U2.28(VDD) U5.10(PVIN) U5.11(PVIN) Y3.6(VCC)
POWER_GND: C1.2 C2.2 C3.2 C4.2 C5.2 C6.1 C7.1 C8.2 C9.2 C10.2 C11.2 C12.2 C13.2 C14.2 C15.2 C16.2 C18.2 C19.2 C20.1 C22.2 C24.2 C25.2 C26.2 C27.2 C28.1 C29.2 C30.2 C31.2 C32.2 C33.2 C34.2 C35.2 C36.2 C38.2 C39.2 C40.2 C41.1 C42.2 C43.2 C44.2 C45.2 C46.2 C47.2 C48.2 C49.2 C50.2 C51.2 C52.2 C53.2 C54.2 C55.2 C56.1 C57.2 C58.2 C59.2 C60.2 C61.2 C62.2 C63.2 C65.2 C66.2 C67.2 C68.2 C69.2 C70.2 C71.2 C72.2 C73.2 C74.2 C75.2 C76.2 C77.2 C78.2 C79.2 C80.2 C81.2 C82.2 C83.2 C84.2 C85.2 C86.2 C87.2 C88.2 C89.2 C90.2 C91.2 C92.2 C93.2 C94.2 C95.2 C96.2 C97.2 C98.2 C99.2 C100.2 C101.2 C102.2 C103.2 C104.2 C105.2 C106.2 C107.2 C108.2 C109.2 D1.1(K) D2.1(K) D3.1(K) D4.1(K) FB2.2 H1.1 H2.1 H3.1 J1.3(Pin_2a) J2.11(1Pin_6a) J2.12(Pin_6b) J3.3(Pin_2a) J5.2 J5.3 J9.1(VeeT) J9.9(VeeR) J9.10(VeeR) J9.11(VeeR) J9.14(VeeR) J9.17(VeeT) J9.20(VeeT) J9.CAGE J11.1(VeeT) J11.9(VeeR) J11.10(VeeR) J11.11(VeeR) J11.14(VeeR) J11.17(VeeT) J11.20(VeeT) J11.CAGE J13.13(GND) J13.14(GND) J13.15(GND) J13.16(GND) J13.A1/B12(GND) J13.B1/A12(GND) R12.1 R13.2 R14.2 R15.2 R29.1 R30.1 R38.1 R39.1 R40.1 R41.1 R42.1 R43.1 R44.1 R49.1 R50.1 R51.1 R52.1 R53.1 R54.1 R55.1 R57.1 R58.1 R62.1 R63.1 R64.1 R65.1 R67.1 R70.1 R71.1 SW1.1 SW1.2 SW2.2 U1.14(VSS) U1.25(VSS) U1.40(VSSA) U1.51(VSS) U1.60(VSS) U1.72(VSS) U1.82(VSS) U1.93(VSS) U1.114(VSS) U1.125(VSS) U1.136(VSS) U1.149(VSS) U1.170(VSS) U1.184(VSS) U1.202(VSS) U2.2(PGND) U2.5(PGND) U2.6(PGND) U2.7(PGND) U2.8(PGND) U2.21(PGND) U2.23(SGND) U2.29(Pgnd_epad) U3.2(GND) U4.129(EPAD) U5.8(AGND) U5.12(PGND) U5.13(GND) Y2.2(GND) Y3.3(GND)
POWER_GNDPWR: FB2.1 J7.8 J7.SH J8.8 J8.SH
PWR_PVD_IN: U1.195(PB6)
RCT0: C49.1 J7.5(RCT)
RCT1: C50.1 J8.5(RCT)
RESREF: R29.2 U4.51(RESREF)
RGMII1_RXD2_RXER: U4.93(GPIO_6)
RMII1_RXD0: R28.2 U4.95(GPIO_4)
RMII1_RXD1: R20.2 U4.94(GPIO_5)
RMII1_TXC_REFCLK: R24.2 R44.2 U4.87(GPIO_10/E2E_CLOCK_EN)
RMII1_TXCTL_TX_DV: R23.2 R43.2 U4.86(GPIO_11/FLOW_EN)
RMII1_TXD0: R22.2 R42.2 U4.85(GPIO_12/EEE_EN)
RMII1_TXD1: R21.2 R41.2 U4.83(GPIO_13/LED_MODE)
S0_MOD_ABS: J9.6(MOD_DEF0) R48.1 U4.80(GPIO_16)
S0_RX+: J9.13(RD+) U4.50(S0_RXP)
S0_RX-: J9.12(RD-) U4.49(S0_RXN)
S0_RX_LOS: J9.8(RX_LOS) R59.1 U4.91(GPIO_7)
S0_TX+: J9.18(TD+) U4.48(S0_TXP)
S0_TX-: J9.19(TD-) U4.46(S0_TXN)
S0_TX_DISABLE: J9.3(TX_DISABLE) R58.2 U4.79(GPIO_17)
S0_TX_FAULT: J9.2(TX_FAULT) R61.1 U4.78(GPIO_18)
S1_MOD_ABS: J11.6(MOD_DEF0) R68.1 U4.76(GPIO_19)
S1_RX+: J11.13(RD+) U4.57(S1_RXP)
S1_RX-: J11.12(RD-) U4.56(S1_RXN)
S1_RX_LOS: J11.8(RX_LOS) R75.1 U4.90(GPIO_8)
S1_TX+: J11.18(TD+) U4.55(S1_TXP)
S1_TX-: J11.19(TD-) U4.53(S1_TXN)
S1_TX_DISABLE: J11.3(TX_DISABLE) R70.2 U4.75(GPIO_20)
S1_TX_FAULT: J11.2(TX_FAULT) R76.1 U4.74(GPIO_21)
SCLK: J2.3(Pin_2a) U1.159(PA14)
SD_125M: J12.2(Pin_1b) J12.4(Pin_2b) U4.71(GPIO_23/SD_125M)
SD_MODE0: R55.2 U4.36(GPIO_39/SD_MODE0)
SFP_EN: R39.2 U4.81(GPIO_15/SFP_EN)
SGPIO_EN: J10.2(Pin_1b) J10.4(Pin_2b) U4.72(GPIO_22/SGPIO_EN)
SI_SLV_CLK: U1.54(PA5) U4.97(GPIO_3)
SI_SLV_DI: U1.173(PD7) U4.100(GPIO_0)
SI_SLV_DO: U1.55(PA6) U4.99(GPIO_1)
SI_SLV_NCS: R36.2 U1.53(PA4) U4.98(GPIO_2)
SS115: C42.1 U5.7(SS)
STATUS: R8.1 U1.134(PG7)
SW15: L2.1 U5.1(SW) U5.2(SW)
SW33: C17.1 C21.1 L1.1 U2.4(SW) U2.9(SW) U2.10(SW) U2.11(SW) U2.12(SW) U2.22(CS) U2.30(SW)
SWDIO: J2.5(Pin_3a) U1.147(PA13)
SWO: J2.9(Pin_5a) U1.192(PB3)
SYNCLKO: R69.1 U4.45(S0_CLKP)
TCT0: C54.1 J7.4(TCT)
TCT1: C55.1 J8.4(TCT)
UART4_RX: J2.4(Pin_2b) U1.11(PI9)
UART4_TX: J2.6(Pin_3b) U1.43(PA0)
USB_D+: U1.146(PA12) U3.4(I/O2)
USB_D-: U1.145(PA11) U3.6(I/O1)
USR: SW2.4(A) U1.12(PI10)
VCAP1: C15.1 U1.148(VCAP)
VCAP2: C12.1 U1.92(VCAP)
VCON: J5.1 Q1.2(D)
VPLL: C37.1 R19.2 U4.126(VDD_PLL)
VREF+: C25.1 C27.1 J4.2(Pin_b1) U1.41(VREF+)
XIN8: C6.2 R5.1 R6.1 Y1.2
XIN25: C56.2 R47.1 Y2.3
XMII_MODE1: U4.38(GPIO_38/XMII_MODE1)
XOT8: C7.2 R5.2 R7.1 Y1.1
XTAL_IN: R6.2 R47.2 U1.32(PH0) U4.123(XO)
XTAL_OUT: C41.2 R7.2 U1.33(PH1) U4.124(XI) Y2.1
Y0: J7.12 R34.1
Y1: J8.12 R32.1
NET-(C21-PAD2): C21.2 R10.2
NET-(D1-A): D1.2(A) R1.2
NET-(D2-A): D2.2(A) R2.2
NET-(D3-A): D3.2(A) R8.2
NET-(D4-A): D4.2(A) R9.2
NET-(J10-PIN_1A): J10.1(Pin_1a) R66.2
NET-(J10-PIN_2A): J10.3(Pin_2a) R67.2
NET-(J12-PIN_1A): J12.1(Pin_1a) R72.2
NET-(J12-PIN_2A): J12.3(Pin_2a) R71.2
NET-(SW1-K): C20.2 SW1.3(K)
NET-(SW2-K): C28.2 SW2.3(K)
NET-(U4-RTN_PLL): C37.2 U4.125(RTN_PLL)
NET-(U5-AVIN): C46.1 C51.1 R46.1 U5.9(AVIN)
NET-(Y2-GND__1): R38.2 R45.1 Y2.4(GND__1)

Not connected (* = marked no-connect by the designer): C110 1 2; D6 2(NC); DC1 1 2 3; J2 8(Pin_4b)* 10(Pin_5b)*; J7 7(NC); J8 7(NC); J9 7(RATE_SELECT)*; J11 7(RATE_SELECT)*; J13 A8(SBU1)* B8(SBU2)*; R28 1; SW2 1; U1 1(PE2) 2(PE3) 3(PE4) 4(PE5) 5(PE6) 7(PI8) 8(PC13) 9(PC14) 10(PC15) 13(PI11) 16(PF0) 17(PF1) 18(PF2) 19(PI12) 20(PI13) 21(PI14) 22(PF3) 23(PF4) 24(PF5) 27(PF6) 28(PF7) 29(PF8) 30(PF9) 31(PF10) 35(PC0) 37(PC2_C) 38(PC3_C) 46(PH2) 47(PH3) 48(PH4) 49(PH5) 50(PA3) 61(PB0) 62(PB1) 63(PB2) 64(PI15) 65(PJ0) 66(PJ1) 67(PJ2) 68(PJ3) 69(PJ4) 70(PF11) 71(PF12) 74(PF13) 75(PF14) 76(PF15) 77(PG0) 78(PG1) 79(PE7) 80(PE8) 81(PE9) 84(PE10) 85(PE11) 86(PE12) 87(PE13) 88(PE14) 89(PE15) 90(PB10) 95(PJ5) 96(PH6) 97(PH7) 98(PH8) 99(PH9) 100(PH10) 101(PH11) 102(PH12) 106(PB14) 107(PB15) 108(PD8) 109(PD9) 110(PD10) 111(PD11) 112(PD12) 113(PD13) 116(PD14) 117(PD15) 118(PJ6) 119(PJ7) 120(PJ8) 121(PJ9) 122(PJ10) 123(PJ11) 126(PK0) 127(PK1) 128(PK2) 129(PG2) 130(PG3) 131(PG4) 132(PG5) 138(PC6) 139(PC7) 140(PC8) 141(PC9) 142(PA8) 143(PA9) 144(PA10) 151(PH13) 152(PH14) 153(PH15) 154(PI0) 155(PI1) 156(PI2) 157(PI3) 160(PA15) 161(PC10) 162(PC11) 163(PC12) 164(PD0) 165(PD1) 166(PD2) 167(PD3) 168(PD4) 174(PJ12) 175(PJ13) 176(PJ14) 177(PJ15) 178(PG9) 179(PG10) 180(PG11) 181(PG12) 182(PG13) 183(PG14) 186(PK3) 187(PK4) 188(PK5) 189(PK6) 190(PK7) 191(PG15) 193(PB4) 194(PB5) 196(PB7) 198(PB8) 199(PB9) 200(PE0) 201(PE1) 205(PI4) 206(PI5) 207(PI6) 208(PI7); U2 3(NC) 25(PG)*; U4 1(P2_AP)* 2(P2_AN)* 4(P2_BP)* 5(P2_BN)* 7(P2_CP)* 8(P2_CN)* 9(P2_DP)* 10(P2_DN)* 11(P3_AP)* 12(P3_AN)* 13(P3_BP)* 14(P3_BN)* 17(P3_CP)* 18(P3_CN)* 19(P3_DP)* 20(P3_DN)* 21(P4_AP)* 22(P4_AN)* 23(P4_BP)* 24(P4_BN)* 26(P4_CP)* 27(P4_CN)* 29(P4_DP)* 30(P4_DN)* 64(GPIO_29); U5 3(PG)*; Y3 2(NC) 5(NC)

## Notes on the sheets
sheet 2
- @3.3V / 6A
sheet 3
- @1.15V / 3A
- MIC23303YML-TR
- Strap Pins unused in managed mode
- Strap Pins managed mode
